# EasyEDA Pro project ProPrj_guitar_2026-09-09.epro

# Schematic Schematic1
Assembly Variant: Basic; Board Name: Board1; Create Date: 2026-09-07; Page Name: P1; Project Name: guitar; Schematic Name: Schematic1; Update Date: 2026-09-07; Company: 嘉立创EDA; Page Size: A4; Version: V1.0
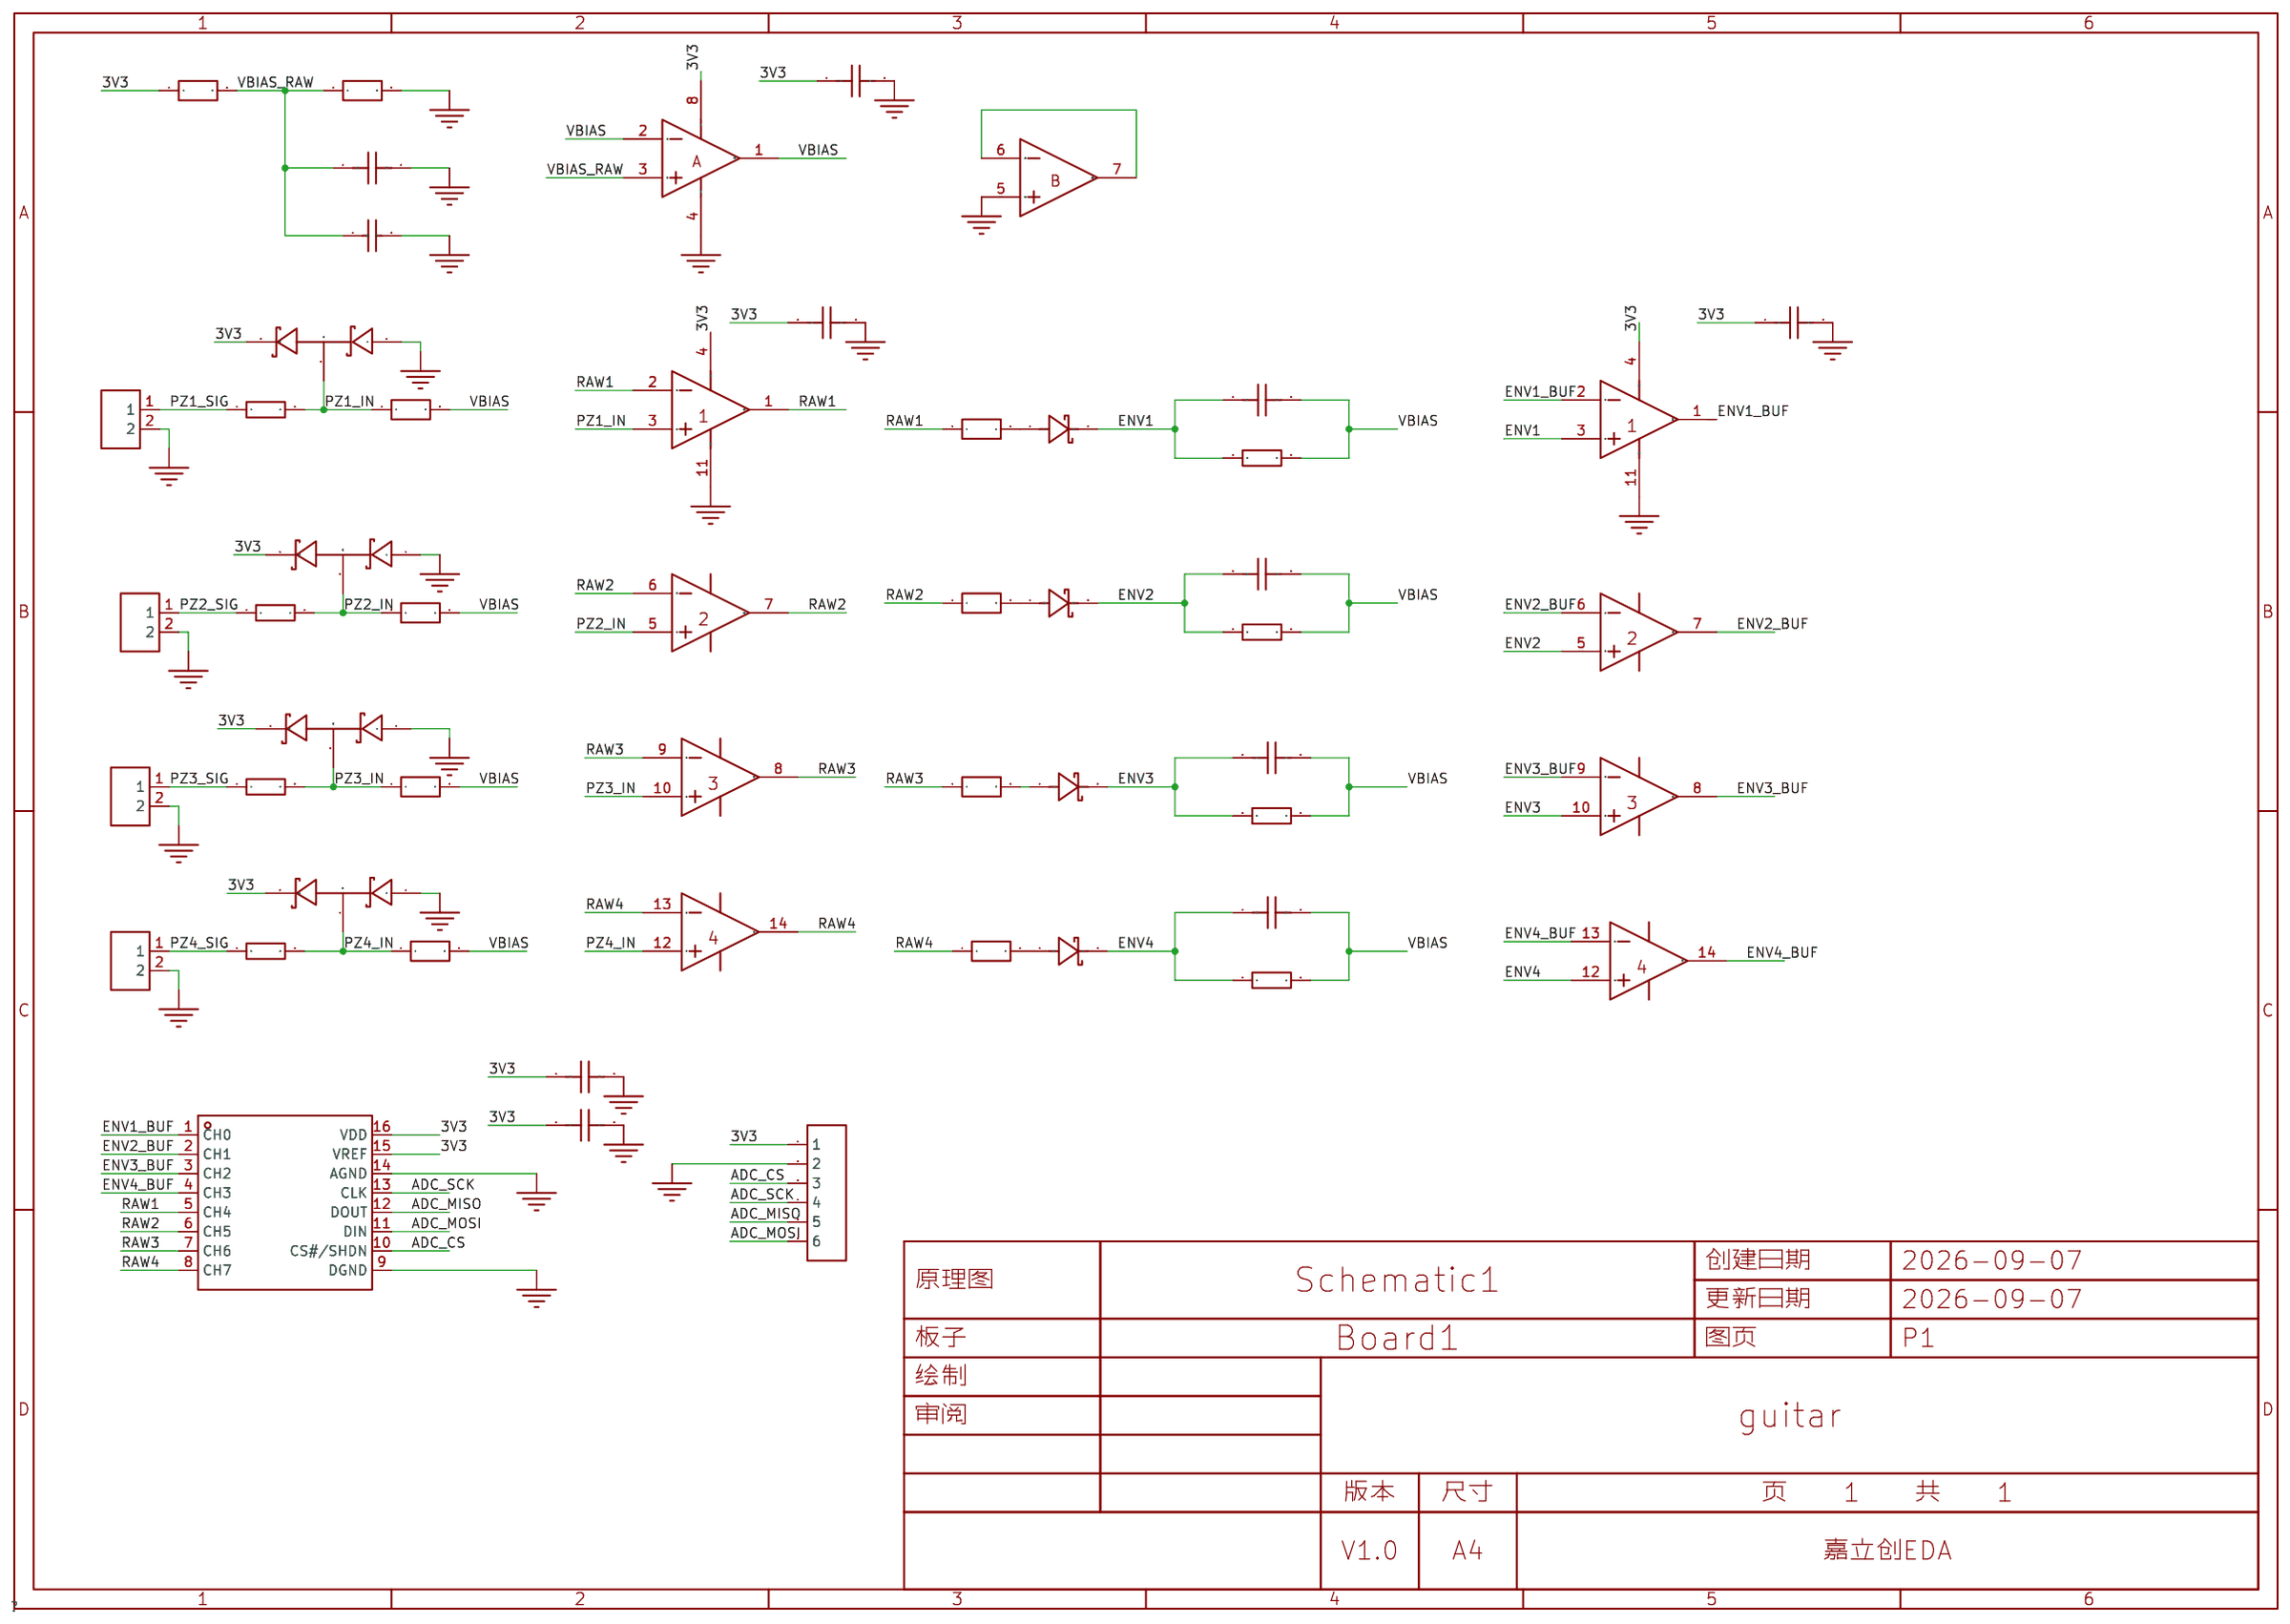
[diagram p0: schematic sheet]

## Parts
C1  100nF  [C0805]
C2  100nF  [C0805]
C3  100nF  [C0805]
C4  100nF  [C0805]
C5  10uF  [C0805]
C6  100uF  [C0805]
C7  100nF  [C0805]
C8  100nF  [C0805]
C9  100nF  [C0805]
C10  100nF  [C0805]
C11  100nF  [C0805]
D1  BAT54SLT1G  [SOT-23_L2.9-W1.3-P1.90-LS2.4-BR]
D2  BAT54SLT1G  [SOT-23_L2.9-W1.3-P1.90-LS2.4-BR]
D3  BAT54SLT1G  [SOT-23_L2.9-W1.3-P1.90-LS2.4-BR]
D4  BAT54SLT1G  [SOT-23_L2.9-W1.3-P1.90-LS2.4-BR]
D5  1N4148W  [SOD-123_L2.7-W1.6-LS3.7-FD]
D6  1N4148W  [SOD-123_L2.7-W1.6-LS3.7-FD]
D7  1N4148W  [SOD-123_L2.7-W1.6-LS3.7-FD]
D8  1N4148W  [SOD-123_L2.7-W1.6-LS3.7-FD]
J2  2.54-1x6P直针  [HDR-TH_6P-P2.54-V-M-1]
J_PZ1  DB125-2.54-2P-GN-S  [CONN-TH_DB125-2.54-2P-GN]
J_PZ2  DB125-2.54-2P-GN-S  [CONN-TH_DB125-2.54-2P-GN]
J_PZ3  DB125-2.54-2P-GN-S  [CONN-TH_DB125-2.54-2P-GN]
J_PZ4  DB125-2.54-2P-GN-S  [CONN-TH_DB125-2.54-2P-GN]
R101  100kΩ  [R0805]
R102  1MΩ  [R0805]
R103  1kΩ  [R0805]
R104  470kΩ  [R0805]
R105  100kΩ  [R0805]
R106  1MΩ  [R0805]
R107  1kΩ  [R0805]
R108  470kΩ  [R0805]
R109  100kΩ  [R0805]
R110  1MΩ  [R0805]
R111  1kΩ  [R0805]
R112  470kΩ  [R0805]
R113  100kΩ  [R0805]
R114  1MΩ  [R0805]
R115  1kΩ  [R0805]
R116  470kΩ  [R0805]
R201  10kΩ  [R0805]
R202  10kΩ  [R0805]
U1  TLV9064IDR  [SOIC-14_L8.7-W3.9-P1.27-LS6.0-BL]  (sections 1,2,3,4)
U2  TLV9064IDR  [SOIC-14_L8.7-W3.9-P1.27-LS6.0-BL]  (sections 1,2,3,4)
U3  TLV9062IDR  [SOIC-8_L5.0-W4.0-P1.27-LS6.0-BL]  (sections 1,2)
U6  MCP3208-CI/P  [PDIP-16_L19.2-W6.6-P2.54-LS7.62-BL]

## Library data of the parts
C1-C4 C7-C11 = FCC0805B104K500DT: 容值:100nF;精度:±10%;额定电压:50V;温度系数:X7R;; LCSC Part Name: 100nF ±10% 50V; Supplier Part: C5137467; Manufacturer: FOJAN(富捷); Supplier Footprint: 0805; JLCPCB Part Class: Extended Part; Datasheet: https://item.szlcsc.com/datasheet/FCC0805B104K500DT/5746969.html; Supplier: LCSC; Tolerance: ±10%; Voltage Rating: 50V; Temperature Coefficient: X7R; Operating Temperature: -55℃~+125℃
C5 = HGC0805R5106K250NSLJ: 容值:10uF;精度:±10%;额定电压:25V;温度系数:X5R;; LCSC Part Name: 10uF ±10% 25V; Supplier Part: C19103847; Manufacturer: Chinocera(华瓷); Supplier Footprint: 0805; JLCPCB Part Class: Extended Part; Datasheet: https://item.szlcsc.com/datasheet/HGC0805R5106K250NSLJ/20314359.html; Supplier: LCSC; Tolerance: ±10%; Voltage Rating: 25V; Temperature Coefficient: X5R
C6 = GRM21BR60J107ME15L: 容值:100uF;精度:±20%;额定电压:6.3V;温度系数:X5R;; LCSC Part Name: 100uF ±20% 6.3V; Supplier Part: C141660; Manufacturer: muRata(村田); Supplier Footprint: 0805; JLCPCB Part Class: Extended Part; Datasheet: https://item.szlcsc.com/datasheet/GRM21BR60J107ME15L/152991.html; Supplier: LCSC; Tolerance: ±20%; Voltage Rating: 6.3V; Temperature Coefficient: X5R
D1-D4 = BAT54SLT1G: 二极管配置:1对串联式;正向压降(Vf):800mV@100mA;直流反向耐压(Vr):30V;整流电流:200mA;; LCSC Part Name: 电压:30V 电流:200mA; Supplier Part: C19726; Manufacturer: onsemi(安森美); Supplier Footprint: SOT-23; JLCPCB Part Class: Extended Part; Datasheet: https://item.szlcsc.com/datasheet/BAT54SLT1G/20435.html; Supplier: LCSC; Diode Configuration: 1对串联式; Voltage - Forward(Vf@If): 800mV@100mA; Voltage - DC Reverse(Vr): 30V; Current - Rectified: 200mA; Reverse Leakage Current (Ir): 2uA@25V; Operating Junction Temperature Range: -55℃~+150℃
D5-D8 = 1N4148W_C7420318: 二极管配置:独立式;整流电流:150mA;直流反向耐压(Vr):100V;正向压降(Vf):1.25V@150mA;反向恢复时间(Trr):4ns;; LCSC Part Name: 100V 150mA; Supplier Part: C7420318; Manufacturer: R+O(宏嘉诚); Supplier Footprint: SOD-123; JLCPCB Part Class: Extended Part; Datasheet: https://item.szlcsc.com/datasheet/1N4148W/8397140.html; Supplier: LCSC; Diode Configuration: 独立式; Pd - Power Dissipation: 400mW; Current - Rectified: 150mA; Voltage - DC Reverse(Vr): 100V; Voltage - Forward(Vf@If): 1.25V@150mA; Non-Repetitive Peak Forward Surge Current: 2A; Reverse Leakage Current (Ir): 1uA@75V; Reverse Recovery Time (trr): 4ns; Operating Junction Temperature Range: -55℃~+150℃
J2 = 2.54-1x6P直针: 插针结构:1x6P;间距:2.54mm;行距:-;圆针/方针:方针;安装方式:直插;排数:单排;总PIN位数:6P;额定电流:3A;额定电压:-;配合针长度:6mm;塑高:2.5mm;端接针长度:3mm;触头材质:黄铜;触头镀层:金;工作温度:-40℃~+105℃;颜色:黑色;; LCSC Part Name: 1x6P 间距:2.54mm 方针 直插; Supplier Part: C37208; Manufacturer: BOOMELE(博穆精密); Supplier Footprint: 插件,P=2.54mm; JLCPCB Part Class: Extended Part; Datasheet: https://item.szlcsc.com/datasheet/2.54-1x6P%25E7%259B%25B4%25E9%2592%2588/38187.html; Supplier: LCSC; Pin Structure: 1x6P; Pitch: 2.54mm; Circluar Pins/Square Pins: 方针; Mounting Type: 直插; Number of Rows: 单排; Number of Pins: 6P; Current Rating: 3A; Length of Mating Pin: 6mm; Insulation Height: 2.5mm; Length of End Connection Pin: 3mm; Contact Material: 黄铜; Contact Plating: 金; Operating Temperature: -40℃~+105℃; Color: 黑色
J_PZ1-J_PZ4 = DB125-2.54-2P-GN-S: 结构:1x2P;间距:2.54mm;颜色:绿色;安装类型:直插;排数:1;每排PIN数:2;额定电流:7A;额定电压:150V;线规 - AWG:18~26;线规 - 平方毫米:1;工作温度:-40℃~+105℃;; LCSC Part Name: 1x2P 2.54mm 直插 排数:1 每排P数:2; Supplier Part: C918120; Manufacturer: DORABO(地博电气); Supplier Footprint: 插件,P=2.54mm; JLCPCB Part Class: Extended Part; Datasheet: https://item.szlcsc.com/datasheet/DB125-2.54-2P-GN-S/993699.html; Supplier: LCSC; Number of Positions or Pins: 1x2P; Pitch: 2.54mm; Color: 绿色; Mounting Type: 直插; Number of Pins: 2P; Number of Rows: 1; Number of PINs Per Row: 2; Screw Specification: M1.6; Current Rating: 7A; Voltage Rating (Max): 150V; Wire Gauge - AWG: 18~26; Wire Gauge - mm2: 1; Operating Temperature: -40℃~+105℃; Height Above Board: 8.4mm
R101 R105 R109 R113 = 0805W8F1003T5E: 电阻类型:厚膜电阻;阻值:100kΩ;精度:±1%;功率:125mW;工作电压:150V;温度系数:±100ppm/℃;; LCSC Part Name: 100kΩ ±1% 125mW 厚膜电阻; Supplier Part: C149504; Manufacturer: UNI-ROYAL(厚声); Supplier Footprint: 0805; JLCPCB Part Class: Basic Part; Datasheet: https://item.szlcsc.com/datasheet/0805W8F1003T5E/160838.html; Supplier: LCSC; Type: 厚膜电阻; Tolerance: ±1%; Power(Watts): 125mW; Voltage-Supply(Max): 150V; Temperature Coefficient: ±100ppm/℃; Operating Temperature: -55℃~+155℃
R102 R106 R110 R114 = FRC0805F1004TS: 电阻类型:厚膜电阻;阻值:1MΩ;精度:±1%;功率:125mW;工作电压:150V;温度系数:±100ppm/℃;; LCSC Part Name: 1MΩ ±1% 125mW 厚膜电阻; Supplier Part: C2933280; Manufacturer: FOJAN(富捷); Supplier Footprint: 0805; JLCPCB Part Class: Extended Part; Supplier: LCSC; Type: 厚膜电阻; Tolerance: ±1%; Power(Watts): 125mW; Voltage-Supply(Max): 150V; Temperature Coefficient: ±100ppm/℃; Operating Temperature: -55℃~+155℃
R103 R107 R111 R115 = FRC0805F1001TS: 电阻类型:厚膜电阻;阻值:1kΩ;精度:±1%;功率:125mW;工作电压:150V;温度系数:±100ppm/℃;; LCSC Part Name: 1kΩ ±1% 125mW 厚膜电阻; Supplier Part: C2907232; Manufacturer: FOJAN(富捷); Supplier Footprint: 0805; JLCPCB Part Class: Extended Part; Supplier: LCSC; Type: 厚膜电阻; Tolerance: ±1%; Power(Watts): 125mW; Voltage-Supply(Max): 150V; Temperature Coefficient: ±100ppm/℃; Operating Temperature: -55℃~+155℃
R104 R108 R112 R116 = 0805W8F4703T5E: 电阻类型:厚膜电阻;阻值:470kΩ;精度:±1%;功率:125mW;工作电压:150V;温度系数:±100ppm/℃;; LCSC Part Name: 厚膜电阻 470kΩ ±1%; Supplier Part: C17709; Manufacturer: UNI-ROYAL(厚声); Supplier Footprint: 0805; JLCPCB Part Class: Basic Part; Datasheet: https://item.szlcsc.com/datasheet/0805W8F4703T5E/18397.html; Supplier: LCSC; Type: 厚膜电阻; Tolerance: ±1%; Power(Watts): 125mW; Voltage-Supply(Max): 150V; Temperature Coefficient: ±100ppm/℃; Operating Temperature: -55℃~+155℃
R201 R202 = FRC0805F1002TS: 电阻类型:厚膜电阻;阻值:10kΩ;精度:±1%;功率:125mW;工作电压:150V;温度系数:±100ppm/℃;; LCSC Part Name: 10kΩ ±1% 125mW 厚膜电阻; Supplier Part: C2907219; Manufacturer: FOJAN(富捷); Supplier Footprint: 0805; JLCPCB Part Class: Extended Part; Supplier: LCSC; Type: 厚膜电阻; Tolerance: ±1%; Power(Watts): 125mW; Voltage-Supply(Max): 150V; Temperature Coefficient: ±100ppm/℃; Operating Temperature: -55℃~+155℃
U1 U2 = TLV9064IDR: 放大器数:4;轨到轨:轨到轨输入,轨到轨输出;增益带宽积(GBW):10MHz;输入失调电压(Vos):300uV;压摆率(SR):6.5V/us;输入偏置电流(Ib):0.5pA;; LCSC Part Name: 适用于成本敏感型系统的10 MHz、轨到轨输入输出（RRIO）CMOS运算放大器; Supplier Part: C388176; Manufacturer: TI(德州仪器); Supplier Footprint: SOIC-14; JLCPCB Part Class: Extended Part; Datasheet: https://www.ti.com/cn/lit/ds/symlink/tlv9064.pdf; Supplier: LCSC; Number of Channels: 4; Rail to Rail: 轨到轨输入,轨到轨输出; Gain Bandwidth Product: 10MHz; Vos - Input Offset Voltage: 300uV; Input Offset Voltage Drift(Vos TC): 530nV/℃; Slew Rate: 6.5V/us; Ib - Input Bias Current: 0.5pA; Input Offset Current(Ios): 0.05pA; Input Voltage Noise Density: 16nV/√Hz@1kHz; Common Mode Rejection Ratio(CMRR): 103dB; Quiescent Current: 538uA; Output Current: 50mA; Operating Temperature: -40℃~+125℃; Single supply: 1.8V~5.5V; Features: 使能/关断功能；ESD保护；EMI滤波/RF抑制
U3 = TLV9062IDR: 放大器数:2;轨到轨:轨到轨输入,轨到轨输出;增益带宽积(GBW):10MHz;输入失调电压(Vos):1.6mV;压摆率(SR):6.5V/us;输入偏置电流(Ib):0.5pA;; LCSC Part Name: 适用于成本敏感型系统的10MHz、轨到轨输入输出（RRIO）CMOS运算放大器; Supplier Part: C398355; Manufacturer: TI(德州仪器); Supplier Footprint: SOIC-8; JLCPCB Part Class: Extended Part; Datasheet: https://www.ti.com/cn/lit/gpn/tlv9061; Supplier: LCSC; Number of Channels: 2; Maximum Power Supply Range (Vdd-Vss): 5.5V; Rail to Rail: 轨到轨输入,轨到轨输出; Gain Bandwidth Product: 10MHz; Vos - Input Offset Voltage: 1.6mV; Input Offset Voltage Drift(Vos TC): 530nV/℃; Slew Rate: 6.5V/us; Ib - Input Bias Current: 0.5pA; Input Offset Current(Ios): 0.05pA; Input Voltage Noise Density: 10nV/√Hz@1kHz; Common Mode Rejection Ratio(CMRR): 103dB; Quiescent Current: 538uA; Output Current: 50mA; Operating Temperature: -40℃~+125℃; Single supply: 1.8V~5.5V; Features: 使能/关断功能；ESD保护；EMI滤波/RF抑制
U6 = MCP3208-CI/P: 分辨率(位):12;采样率:100kHz;工作电压:2.7V~5.5V;接口类型:SPI;; LCSC Part Name: MCP3208 CI/P; Supplier Part: C1543277; Manufacturer: MICROCHIP(美国微芯); Supplier Footprint: PDIP-16; JLCPCB Part Class: Extended Part; Datasheet: https://item.szlcsc.com/datasheet/MCP3208-CI%252FP/1634080.html; Supplier: LCSC; Resolution (Bits): 12; Sampling Rate: 100kHz; number of channels: 8; Voltage - Supply: 2.7V~5.5V; Interface: SPI; differential input: 是; Integral non - linearity: 1LSB; Operating Temperature: -40℃~+85℃; Clock/Oscillator: 外置; Clock Frequency: 2MHz；1MHz; Voltage Reference: 外置; Programmable Gain: 不支持; ADC architecture: SAR; Quiescent Current (Iq): 500nA; Features: 多路复用器; DNL (LSB): 0.5LSB

## Nets
3V3: C7.1 C8.1 C9.1 C10.1 C11.1 D1.2(C) D2.2(C) D3.2(C) D4.2(C) J2.1 R201.1 U1.4(V+) U2.4(V+) U3.8(VCC) U6.15(VREF) U6.16(VDD)
GND: C5.2 C6.2 C7.2 C8.2 C9.2 C10.2 C11.2 D1.1(A) D2.1(A) D3.1(A) D4.1(A) J2.2 J_PZ1.2 J_PZ2.2 J_PZ3.2 J_PZ4.2 R202.2 U1.11(V-) U2.11(V-) U3.4(VEE/GND) U3.5(INB+) U6.9(DGND) U6.14(AGND)
ADC_CS: J2.3 U6.10(CS#/SHDN)
ADC_MISO: J2.5 U6.12(DOUT)
ADC_MOSI: J2.6 U6.11(DIN)
ADC_SCK: J2.4 U6.13(CLK)
ENV1: C4.1 D5.2(K) R104.1 U1.3(IN1+)
ENV1_BUF: U1.1(OUT1) U1.2(IN1-) U6.1(CH0)
ENV2: C1.1 D6.2(K) R108.1 U1.5(IN2+)
ENV2_BUF: U1.6(IN2-) U1.7(OUT2) U6.2(CH1)
ENV3: C2.1 D7.2(K) R112.1 U1.10(IN3+)
ENV3_BUF: U1.8(OUT3) U1.9(IN3-) U6.3(CH2)
ENV4: C3.1 D8.2(K) R116.1 U1.12(IN4+)
ENV4_BUF: U1.13(IN4-) U1.14(OUT4) U6.4(CH3)
PZ1_IN: D1.3(A/C) R101.2 R102.1 U2.3(IN1+)
PZ1_SIG: J_PZ1.1 R101.1
PZ2_IN: D2.3(A/C) R105.2 R106.1 U2.5(IN2+)
PZ2_SIG: J_PZ2.1 R105.1
PZ3_IN: D3.3(A/C) R109.2 R110.1 U2.10(IN3+)
PZ3_SIG: J_PZ3.1 R109.1
PZ4_IN: D4.3(A/C) R113.2 R114.1 U2.12(IN4+)
PZ4_SIG: J_PZ4.1 R113.1
RAW1: R103.1 U2.1(OUT1) U2.2(IN1-) U6.5(CH4)
RAW2: R107.1 U2.6(IN2-) U2.7(OUT2) U6.6(CH5)
RAW3: R111.1 U2.8(OUT3) U2.9(IN3-) U6.7(CH6)
RAW4: R115.1 U2.13(IN4-) U2.14(OUT4) U6.8(CH7)
VBIAS: C1.2 C2.2 C3.2 C4.2 R102.2 R104.2 R106.2 R108.2 R110.2 R112.2 R114.2 R116.2 U3.1(OUTA) U3.2(INA-)
VBIAS_RAW: C5.1 C6.1 R201.2 R202.1 U3.3(INA+)
Net-(D5-1): D5.1(A) R103.2
Net-(D6-1): D6.1(A) R107.2
Net-(D7-1): D7.1(A) R111.2
Net-(D8-1): D8.1(A) R115.2
Net-(U3-6): U3.6(INB-) U3.7(OUTB)
